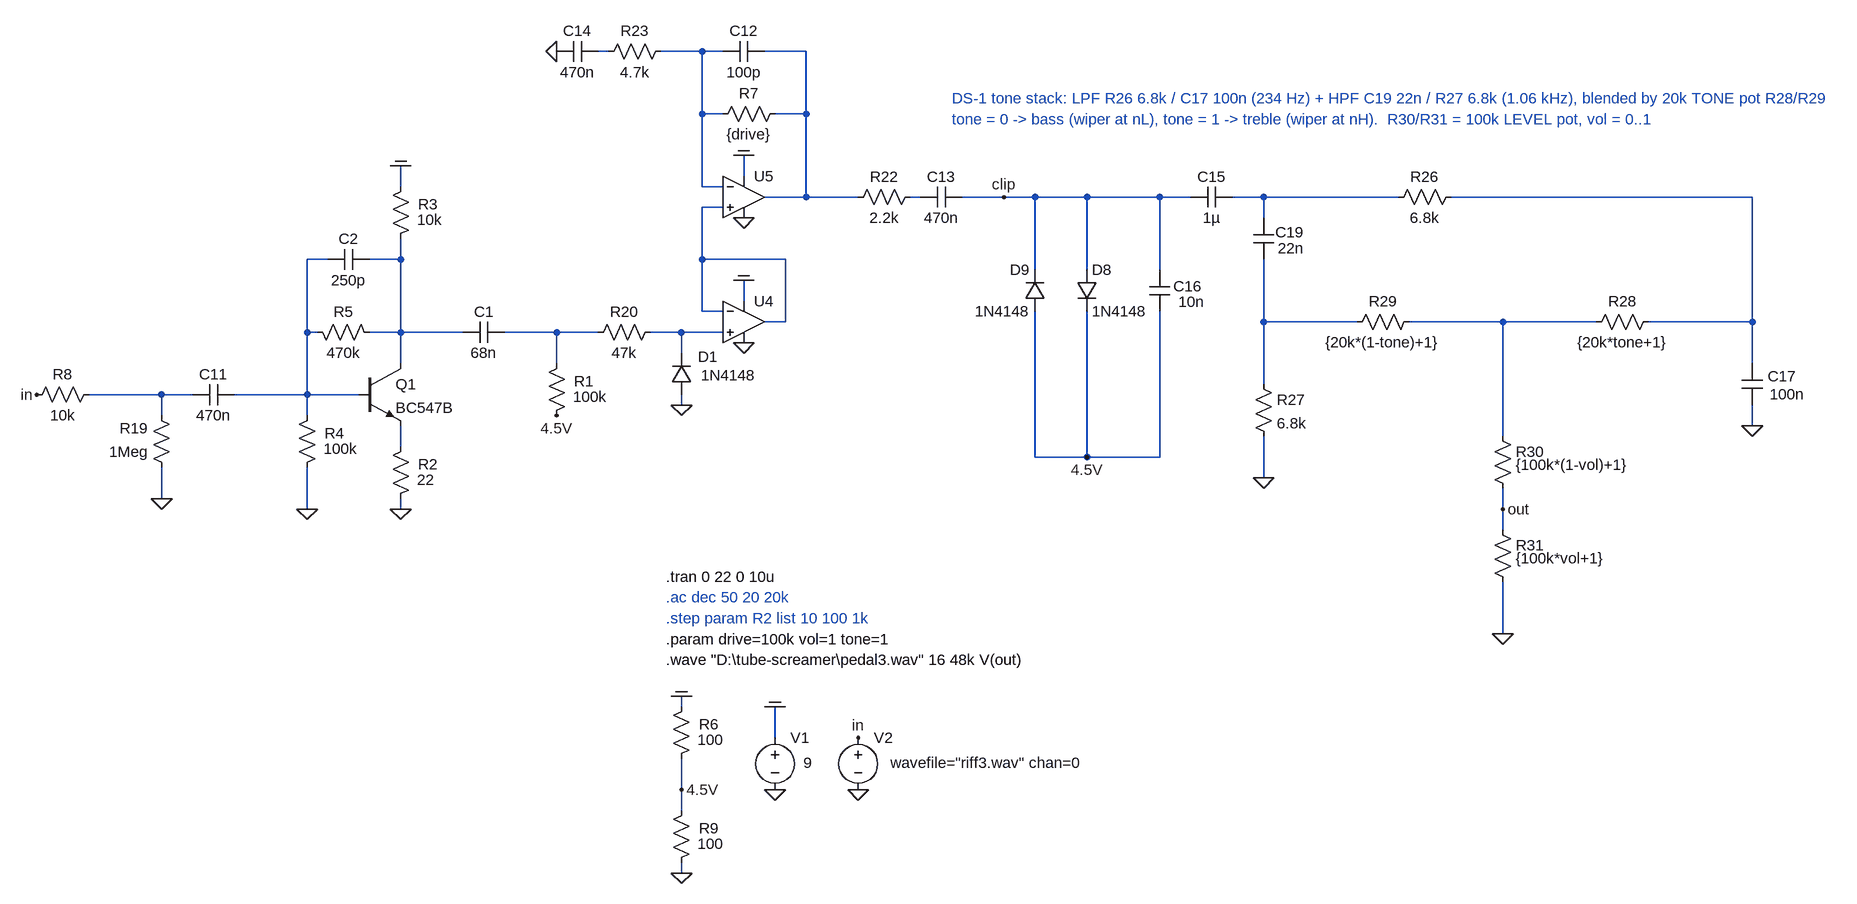
[diagram p0: schematic Hard Clipper Tone.asc]
Hard Clipper Tone.asc, the LTspice schematic file:
Version 4.1
SHEET 1 3404 1296
WIRE -336 -1568 -352 -1568
WIRE -192 -1568 -256 -1568
WIRE -160 -1568 -192 -1568
WIRE -32 -1568 -96 -1568
WIRE -192 -1472 -192 -1568
WIRE -160 -1472 -192 -1472
WIRE -32 -1472 -32 -1568
WIRE -32 -1472 -80 -1472
WIRE -128 -1376 -128 -1408
WIRE -656 -1360 -656 -1392
WIRE -192 -1360 -192 -1472
WIRE -160 -1360 -192 -1360
WIRE -32 -1344 -32 -1472
WIRE -32 -1344 -96 -1344
WIRE 48 -1344 -32 -1344
WIRE 144 -1344 128 -1344
WIRE 272 -1344 208 -1344
WIRE 320 -1344 272 -1344
WIRE 400 -1344 320 -1344
WIRE 512 -1344 400 -1344
WIRE 560 -1344 512 -1344
WIRE 672 -1344 624 -1344
WIRE 880 -1344 672 -1344
WIRE 1424 -1344 960 -1344
WIRE -160 -1328 -192 -1328
WIRE 672 -1312 672 -1344
WIRE -768 -1248 -800 -1248
WIRE -656 -1248 -656 -1280
WIRE -656 -1248 -704 -1248
WIRE -192 -1248 -192 -1328
WIRE -64 -1248 -192 -1248
WIRE 320 -1232 320 -1344
WIRE 400 -1232 400 -1344
WIRE 512 -1232 512 -1344
WIRE -128 -1184 -128 -1216
WIRE -192 -1168 -192 -1248
WIRE -160 -1168 -192 -1168
WIRE -64 -1152 -64 -1248
WIRE -64 -1152 -96 -1152
WIRE 672 -1152 672 -1248
WIRE 816 -1152 672 -1152
WIRE 1040 -1152 896 -1152
WIRE 1184 -1152 1040 -1152
WIRE 1424 -1152 1424 -1344
WIRE 1424 -1152 1264 -1152
WIRE -800 -1136 -800 -1248
WIRE -784 -1136 -800 -1136
WIRE -656 -1136 -656 -1248
WIRE -656 -1136 -704 -1136
WIRE -560 -1136 -656 -1136
WIRE -416 -1136 -496 -1136
WIRE -352 -1136 -416 -1136
WIRE -224 -1136 -272 -1136
WIRE -160 -1136 -224 -1136
WIRE -224 -1104 -224 -1136
WIRE -656 -1088 -656 -1136
WIRE -416 -1088 -416 -1136
WIRE 1424 -1088 1424 -1152
WIRE 672 -1056 672 -1152
WIRE -1024 -1040 -1136 -1040
WIRE -976 -1040 -1024 -1040
WIRE -800 -1040 -800 -1136
WIRE -800 -1040 -912 -1040
WIRE -720 -1040 -800 -1040
WIRE -224 -1024 -224 -1040
WIRE -1024 -1008 -1024 -1040
WIRE -800 -1008 -800 -1040
WIRE 1424 -992 1424 -1024
WIRE 1040 -976 1040 -1152
WIRE -656 -960 -656 -992
WIRE 320 -944 320 -1168
WIRE 400 -944 400 -1168
WIRE 400 -944 320 -944
WIRE 512 -944 512 -1168
WIRE 512 -944 400 -944
WIRE 672 -912 672 -976
WIRE -1024 -880 -1024 -928
WIRE -800 -864 -800 -928
WIRE -656 -864 -656 -880
WIRE 1040 -864 1040 -896
WIRE 1040 -832 1040 -864
WIRE 1040 -672 1040 -752
WIRE -224 -560 -224 -576
WIRE -80 -512 -80 -560
WIRE -224 -432 -224 -480
WIRE -224 -400 -224 -432
WIRE -224 -304 -224 -320
FLAG 48 -432 0
FLAG -80 -432 0
FLAG -80 -560 COM
FLAG 48 -512 in
FLAG -1216 -1040 in
FLAG -1024 -880 0
FLAG -128 -1120 0
FLAG -128 -1216 COM
FLAG -416 -1008 4.5V
FLAG -128 -1312 0
FLAG -128 -1408 COM
FLAG 1424 -992 0
FLAG -416 -1568 0
FLAG -656 -864 0
FLAG -656 -1392 COM
FLAG -800 -864 0
FLAG 400 -944 4.5V
FLAG -224 -1024 0
FLAG 272 -1344 clip
FLAG 672 -912 0
FLAG 1040 -864 out
FLAG 1040 -672 0
FLAG -224 -304 0
FLAG -224 -576 COM
FLAG -224 -432 4.5V
SYMBOL voltage -80 -528 R0
WINDOW 3 44 54 Left 2
WINDOW 123 0 0 Left 0
WINDOW 39 0 0 Left 0
SYMATTR Value 9
SYMATTR InstName V1
SYMBOL voltage 48 -528 R0
WINDOW 123 0 0 Left 0
WINDOW 39 0 0 Left 0
WINDOW 3 50 54 Left 2
SYMATTR Value wavefile="riff3.wav" chan=0
SYMATTR InstName V2
SYMBOL res -1008 -912 R180
WINDOW 0 36 76 Left 2
WINDOW 3 36 40 Left 2
SYMATTR InstName R19
SYMATTR Value 1Meg
SYMBOL res -256 -1152 R90
WINDOW 0 0 56 VBottom 2
WINDOW 3 32 56 VTop 2
SYMATTR InstName R20
SYMATTR Value 47k
SYMBOL cap -912 -1056 R90
WINDOW 0 0 32 VBottom 2
WINDOW 3 32 32 VTop 2
SYMATTR InstName C11
SYMATTR Value 470n
SYMBOL OpAmps\\UniversalOpAmp2 -128 -1152 R0
SYMATTR InstName U4
SYMATTR Value2 Avol=1Meg GBW=3Meg Slew=10Meg
SYMBOL cap -160 -1552 R270
WINDOW 0 32 32 VTop 2
WINDOW 3 0 32 VBottom 2
SYMATTR InstName C12
SYMATTR Value 100p
SYMBOL cap 208 -1360 R90
WINDOW 0 0 32 VBottom 2
WINDOW 3 32 32 VTop 2
SYMATTR InstName C13
SYMATTR Value 470n
SYMBOL res 144 -1360 R90
WINDOW 0 0 56 VBottom 2
WINDOW 3 32 56 VTop 2
SYMATTR InstName R22
SYMATTR Value 2.2k
SYMBOL OpAmps\\UniversalOpAmp2 -128 -1344 R0
SYMATTR InstName U5
SYMATTR Value2 Avol=1Meg GBW=3Meg Slew=10Meg
SYMBOL res -352 -1552 R270
WINDOW 0 32 56 VTop 2
WINDOW 3 0 56 VBottom 2
SYMATTR InstName R23
SYMATTR Value 4.7k
SYMBOL cap -416 -1552 R270
WINDOW 0 32 32 VTop 2
WINDOW 3 0 32 VBottom 2
SYMATTR InstName C14
SYMATTR Value 470n
SYMBOL cap 624 -1360 R90
WINDOW 0 0 32 VBottom 2
WINDOW 3 32 32 VTop 2
SYMATTR InstName C15
SYMATTR Value 1µ
SYMBOL cap 528 -1168 R180
WINDOW 0 -49 39 Left 2
WINDOW 3 -53 15 Left 2
SYMATTR InstName C16
SYMATTR Value 10n
SYMBOL diode 384 -1232 R0
SYMATTR InstName D8
SYMATTR Value 1N4148
SYMBOL diode 336 -1168 R180
WINDOW 0 24 64 Left 2
WINDOW 3 24 0 Left 2
SYMATTR InstName D9
SYMATTR Value 1N4148
SYMBOL res 976 -1360 R90
WINDOW 0 0 56 VBottom 2
WINDOW 3 32 56 VTop 2
SYMATTR InstName R26
SYMATTR Value 6.8k
SYMBOL cap 1440 -1024 R180
WINDOW 0 -52 44 Left 2
WINDOW 3 -65 17 Left 2
SYMATTR InstName C17
SYMATTR Value 100n
SYMBOL res -432 -992 M180
WINDOW 0 43 69 Left 2
WINDOW 3 41 45 Left 2
SYMATTR InstName R1
SYMATTR Value 100k
SYMBOL npn3 -720 -1088 R0
SYMATTR InstName Q1
SYMATTR Value BC547B
SYMBOL res -672 -864 M180
WINDOW 0 43 69 Left 2
WINDOW 3 41 45 Left 2
SYMATTR InstName R2
SYMATTR Value 22
SYMBOL cap -560 -1120 R270
WINDOW 0 32 32 VTop 2
WINDOW 3 0 32 VBottom 2
SYMATTR InstName C1
SYMATTR Value 68n
SYMBOL res -672 -1264 M180
WINDOW 0 43 69 Left 2
WINDOW 3 41 45 Left 2
SYMATTR InstName R3
SYMATTR Value 10k
SYMBOL res -816 -912 M180
WINDOW 0 43 69 Left 2
WINDOW 3 41 45 Left 2
SYMATTR InstName R4
SYMATTR Value 100k
SYMBOL res -800 -1152 M90
WINDOW 0 0 56 VBottom 2
WINDOW 3 32 56 VTop 2
SYMATTR InstName R5
SYMATTR Value 470k
SYMBOL cap -768 -1232 R270
WINDOW 0 32 32 VTop 2
WINDOW 3 0 32 VBottom 2
SYMATTR InstName C2
SYMATTR Value 250p
SYMBOL diode -208 -1040 R180
WINDOW 0 -40 58 Left 2
WINDOW 3 -99 30 Left 2
SYMATTR InstName D1
SYMATTR Value 1N4148
SYMBOL res -176 -1456 R270
WINDOW 0 32 56 VTop 2
WINDOW 3 0 56 VBottom 2
SYMATTR InstName R7
SYMATTR Value {drive}
SYMBOL res -1232 -1024 R270
WINDOW 0 32 56 VTop 2
WINDOW 3 0 56 VBottom 2
SYMATTR InstName R8
SYMATTR Value 10k
SYMBOL cap 688 -1248 R180
WINDOW 0 -46 42 Left 2
WINDOW 3 -46 17 Left 2
SYMATTR InstName C19
SYMATTR Value 22n
SYMBOL res 656 -1072 R0
SYMATTR InstName R27
SYMATTR Value 6.8k
SYMBOL res 1280 -1168 R90
WINDOW 3 32 56 VTop 2
WINDOW 0 0 56 VBottom 2
SYMATTR Value {20k*tone+1}
SYMATTR InstName R28
SYMBOL res 912 -1168 R90
WINDOW 3 32 56 VTop 2
WINDOW 0 0 56 VBottom 2
SYMATTR Value {20k*(1-tone)+1}
SYMATTR InstName R29
SYMBOL res 1024 -992 R0
WINDOW 3 36 60 Left 2
SYMATTR Value {100k*(1-vol)+1}
SYMATTR InstName R30
SYMBOL res 1024 -848 R0
WINDOW 3 36 60 Left 2
SYMATTR Value {100k*vol+1}
SYMATTR InstName R31
SYMBOL res -240 -464 M180
WINDOW 0 43 69 Left 2
WINDOW 3 41 45 Left 2
SYMATTR InstName R6
SYMATTR Value 100
SYMBOL res -240 -304 M180
WINDOW 0 43 69 Left 2
WINDOW 3 41 45 Left 2
SYMATTR InstName R9
SYMATTR Value 100
TEXT 192 -1496 Left 2 ;DS-1 tone stack: LPF R26 6.8k / C17 100n (234 Hz) + HPF C19 22n / R27 6.8k (1.06 kHz), blended by 20k TONE pot R28/R29
TEXT 192 -1464 Left 2 ;tone = 0 -> bass (wiper at nL), tone = 1 -> treble (wiper at nH).  R30/R31 = 100k LEVEL pot, vol = 0..1
TEXT -248 -728 Left 2 ;.ac dec 50 20 20k
TEXT -248 -696 Left 2 ;.step param R2 list 10 100 1k
TEXT -248 -664 Left 2 !.param drive=100k vol=1 tone=1
TEXT -248 -632 Left 2 !.wave "D:\\tube-screamer\\pedal3.wav" 16 48k V(out)
TEXT -248 -760 Left 2 !.tran 0 22 0 10u

The netlist it stands for:
* Hard Clipper Tone.asc
V1 COM 0 9
V2 in 0 wavefile="riff3.wav" chan=0
R19 0 N014 1Meg
R20 N013 N012 47k
C11 N008 N014 470n
X§U4 N013 N007 COM 0 N007 level2 Avol=1Meg GBW=3Meg Slew=10Meg Ilimit=25m Rail=0 Vos=0 En=0 Enk=0 In=0 Ink=0 Rin=500Meg  ; pins In+ In- V+ V- OUT
C12 N002 N003 100p
C13 clip N004 470n
R22 N004 N003 2.2k
X§U5 N007 N002 COM 0 N003 level2 Avol=1Meg GBW=3Meg Slew=10Meg Ilimit=25m Rail=0 Vos=0 En=0 Enk=0 In=0 Ink=0 Rin=500Meg  ; pins In+ In- V+ V- OUT
R23 N001 N002 4.7k
C14 0 N001 470n
C15 N005 clip 1µ
C16 4.5V clip 10n
D8 clip 4.5V 1N4148
D9 4.5V clip 1N4148
R26 N006 N005 6.8k
C17 0 N006 100n
R1 4.5V N012 100k
Q1 N009 N008 N015 0 BC547B
R2 0 N015 22
C1 N009 N012 68n
R3 N009 COM 10k
R4 0 N008 100k
R5 N008 N009 470k
C2 N008 N009 250p
D1 0 N013 1N4148
R7 N002 N003 {drive}
R8 in N014 10k
C19 N010 N005 22n
R27 N010 0 6.8k
R28 N006 N011 {20k*tone+1}
R29 N011 N010 {20k*(1-tone)+1}
R30 N011 out {100k*(1-vol)+1}
R31 out 0 {100k*vol+1}
R6 4.5V COM 100
R9 0 4.5V 100
.model D D
.lib standard.dio
.model NPN NPN
.model PNP PNP
.lib standard.bjt
* DS-1 tone stack: LPF R26 6.8k / C17 100n (234 Hz) + HPF C19 22n / R27 6.8k (1.06 kHz), blended by 20k TONE pot R28/R29
* tone = 0 -> bass (wiper at nL), tone = 1 -> treble (wiper at nH).  R30/R31 = 100k LEVEL pot, vol = 0..1
* .ac dec 50 20 20k
* .step param R2 list 10 100 1k
.param drive=100k vol=1 tone=1
.wave "D:\tube-screamer\pedal3.wav" 16 48k V(out)
.tran 0 22 0 10u
.lib UniversalOpAmp2.lib
.backanno
.end